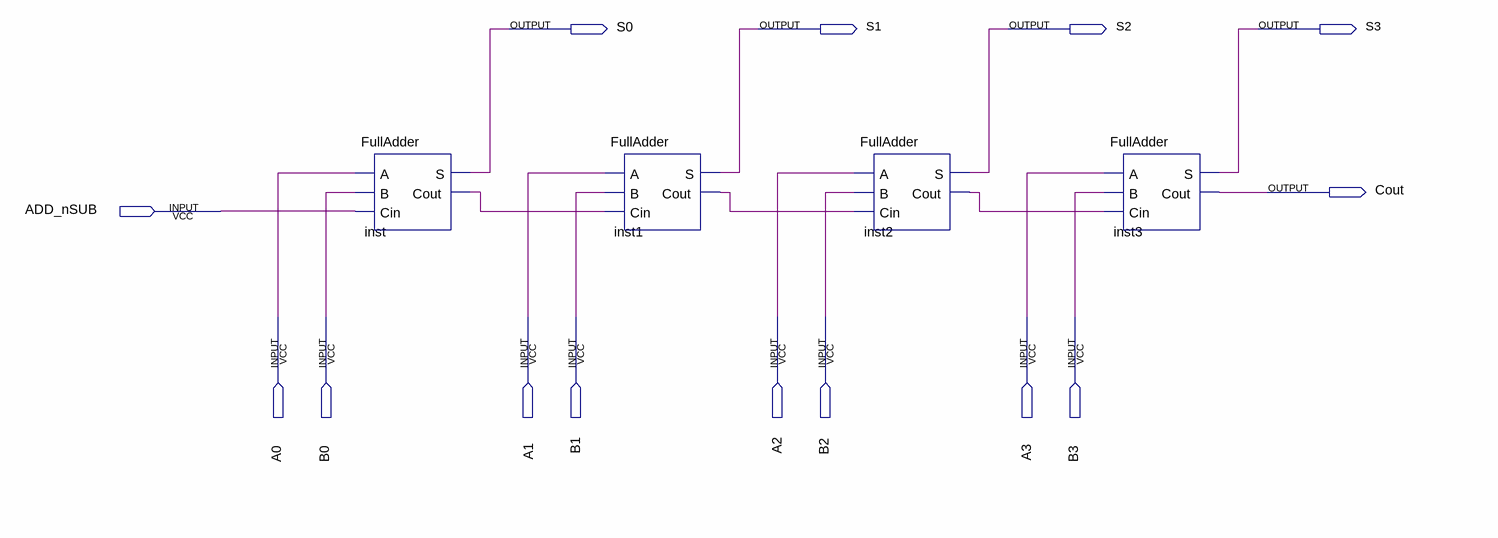
[diagram p0: schematic sheet]
// Quartus schematic AddSub4.bdf as structural Verilog: 4 symbols, 14 pins
module AddSub4 (
  input  ADD_nSUB,
  input  A0,
  input  B0,
  input  A1,
  input  B1,
  input  A2,
  input  B2,
  input  A3,
  input  B3,
  output S0,
  output S1,
  output S2,
  output S3,
  output Cout
);

  wire inst1_cout, inst2_cout, inst_cout;

  FullAdder inst (.A(A0), .B(B0), .Cin(ADD_nSUB), .S(S0), .Cout(inst_cout));
  FullAdder inst1 (.A(A1), .B(B1), .Cin(inst_cout), .S(S1), .Cout(inst1_cout));
  FullAdder inst2 (.A(A2), .B(B2), .Cin(inst1_cout), .S(S2), .Cout(inst2_cout));
  FullAdder inst3 (.A(A3), .B(B3), .Cin(inst2_cout), .S(S3), .Cout(Cout));
endmodule
